# Altium schematic sheet Schematic_Hat_Secondary.SchDoc: WackyRacersHat Battery
size A3; DrawnBy: Group 26; Address1: ECE Department; Address2: University of Canterbury; Address3: Christchurch 8041; Address4: New Zealand; Revision: 1; SheetNumber: 2; SheetTotal: 2; ImagePath: \\maxwell\elecapp\AltiumDesigner\Templates\uc-logo.png
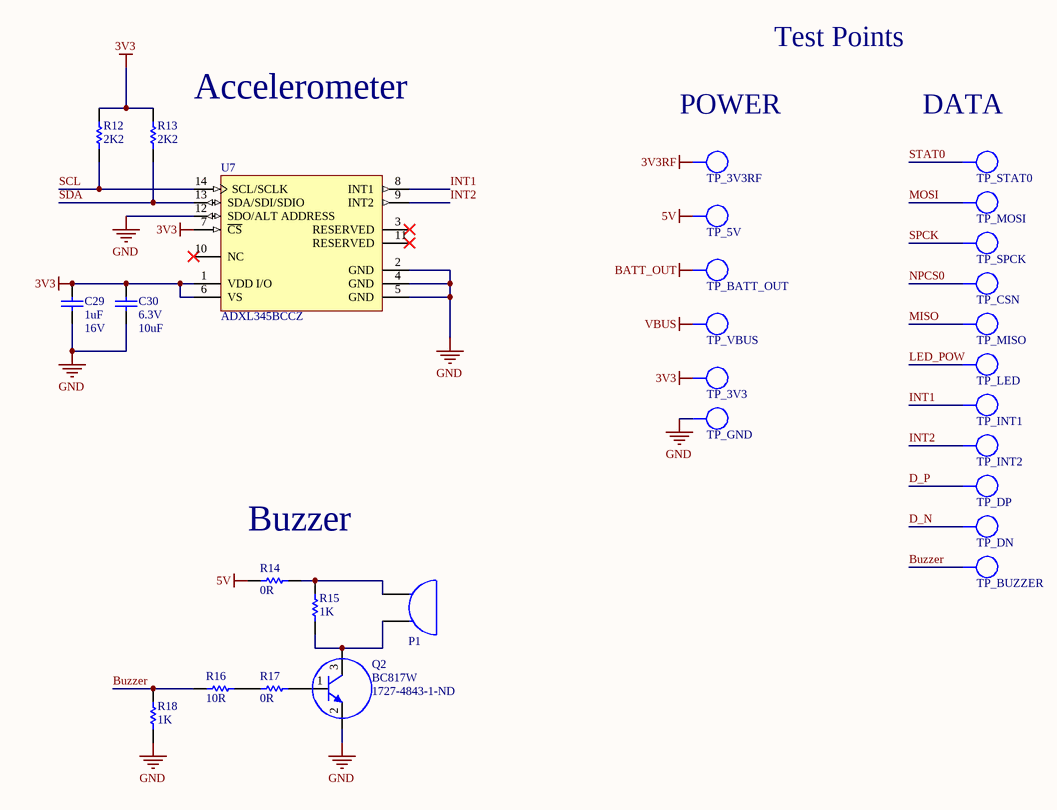
[diagram p0: Schematic_Hat_Secondary.SchDoc]

## Parts
C29  Max Voltage: 16V  [CAPC1608L]  (hidden comment: 1uF)
C30  Voltage - Rated: 6.3V  [CAPC1608L]  (hidden comment: 10uF)
P1  Piezo Buzzer  [BUZZER]  (value not drawn)
Q2  Supplier Part Number 2: 1727-4843-1-ND  [SOT323_M]  (hidden comment: BC817W)
R12  2K2  [RESC1608L]
R13  2K2  [RESC1608L]
R14  0R  [RESC1608L]
R15  1K  [RESC1608L]
R16  10R  [RESC1608L]
R17  0R  [RESC1608L]
R18  1K  [RESC1608L]
TP_3V3  3V3  [TP_1206]  (value not drawn)  (no BOM)
TP_3V3RF  3V3RF  [TP_1206]  (value not drawn)  (no BOM)
TP_5V  5V  [TP_1206]  (value not drawn)  (no BOM)
TP_BATT_OUT  BATT_OUT  [TP_1206]  (value not drawn)  (no BOM)
TP_BUZZER  BUZZER  [TP_1206]  (value not drawn)  (no BOM)
TP_CSN  CSN  [TP_1206]  (value not drawn)  (no BOM)
TP_DN  DN  [TP_1206]  (value not drawn)  (no BOM)
TP_DP  DP  [TP_1206]  (value not drawn)  (no BOM)
TP_GND  GND  [TP_1206]  (value not drawn)  (no BOM)
TP_INT1  INT1  [TP_1206]  (value not drawn)  (no BOM)
TP_INT2  INT2  [TP_1206]  (value not drawn)  (no BOM)
TP_LED  LED  [TP_1206]  (value not drawn)  (no BOM)
TP_MISO  MISO  [TP_1206]  (value not drawn)  (no BOM)
TP_MOSI  MOSI  [TP_1206]  (value not drawn)  (no BOM)
TP_SPCK  SPCK  [TP_1206]  (value not drawn)  (no BOM)
TP_STAT0  STAT0  [TP_1206]  (value not drawn)  (no BOM)
TP_VBUS  VBUS  [TP_1206]  (value not drawn)  (no BOM)
U7  ADXL345BCCZ  [ADI-CC-14-1_V]

## Nets
3V3: C29.2 C30.2 R12.2 R13.2 TP_3V3.1 U7.1(VDD_I/O) U7.6(VS) U7.7(~{CS})
3V3RF: TP_3V3RF.1
5V: R14.2 TP_5V.1
BATT_OUT: TP_BATT_OUT.1
GND: C29.1 C30.1 Q2.2 R18.1 TP_GND.1 U7.2(GND) U7.4(GND) U7.5(GND) U7.12(SDO/ALT_ADDRESS)
VBUS: TP_VBUS.1
Buzzer: R16.1 R18.2 TP_BUZZER.1
D_N: TP_DN.1
D_P: TP_DP.1
INT1: TP_INT1.1 U7.8(INT1)
INT2: TP_INT2.1 U7.9(INT2)
LED_POW: TP_LED.1
MISO: TP_MISO.1
MOSI: TP_MOSI.1
NPCS0: TP_CSN.1
SCL: R12.1 U7.14(SCL/SCLK)
SDA: R13.1 U7.13(SDA/SDI/SDIO)
SPCK: TP_SPCK.1
STAT0: TP_STAT0.1
NetP1_1: P1.1 R14.1 R15.2
NetP1_2: P1.2 Q2.3 R15.1
NetQ2_1: Q2.1 R17.1
NetR16_2: R16.2 R17.2

Not connected (* = marked no-connect by the designer): U7 3(RESERVED)* 10(NC)* 11(RESERVED)*

## Notes on the sheet
- Test Points
- (near R13) Accelerometer
- (near TP_3V3RF) POWER
- (near TP_STAT0) DATA
- Buzzer
- Title
- Drawn by:
- Date:
- Time:
- Revision:
- Sheet
- of
- File:

## Library data of the parts
C29 = CC_1uF_0603: CAP CER 1uF Y5V -20% +80% 16V 0603; PackageReference: 0603; Code_IPC: 1608 [0603]; Verify: *; Supplier: ECE Dept; Storage Location: PCB Assembly WS; Value: 1uF
C30 = CC_10uF_0603: CAP CER 10UF X5R +-20% 6V3 0603; Supplier: ECE Dept; Storage Location: PCB Assembly WS; Value: 10uF
P1 = Piezo Buzzer: TDK - PS1240P02BT - BUZZER, PIEZO, 70DB, 12.2MM; Number of Terminals/Pins: 2; Frequency: 4kHz; Operating Supply Voltage: 3V; Washable: No; Supplier 1: Digi-Key; Manufacturer 1: TDK; Manufacturer Part Number 1: PS1240P02BT; Stock 1: 24025; Pricing 1: 1=0.61000, 10=0.52500, 25=0.49120, 50=0.46580, 100=0.44110 (USD); RoHS: Yes; Mount: Through Hole; Number of Pins: 2; Min Operating Temperature: -10°C; Max Operating Temperature: 70°C; Package Quantity: 1; Packaging: Tape and Reel; Termination: PC Pins; Voltage Rating (DC): 3V; Series: PS; Diameter: 12.2mm; Height: 6.5mm; Lead Free: Lead Free; RoHS Compliant: Yes; ComponentLink1URL: https://datasheet.ciiva.com/0/ef532-ps-112.pdf?src-supplier=Digi-Key; ComponentLink1Description: https://datasheet.ciiva.com/0/ef532-ps-112.pdf?src-supplier=Digi-Key; ComponentLink2URL: https://datasheet.ciiva.com/0/ef532-ps-111.pdf?src-supplier=Digi-Key; ComponentLink2Description: https://datasheet.ciiva.com/0/ef532-ps-111.pdf?src-supplier=Digi-Key; ComponentLink3URL: https://datasheet.ciiva.com/3306/ef532-ps-3306958.pdf?src-supplier=Avnet; ComponentLink3Description: https://datasheet.ciiva.com/3306/ef532-ps-3306958.pdf?src-supplier=Avnet; ComponentLink4URL: https://datasheet.ciiva.com/16225/ef532-ps-16225062.pdf?src-supplier=Onlinecomponents.com; ComponentLink4Description: https://datasheet.ciiva.com/16225/ef532-ps-16225062.pdf?src-supplier=Onlinecomponents.com; Supplier Part Number 1: 445-2525-1-ND
Q2 = TB_BC817W: NPN GP Bipolar Transistor 45V 500mA SOT323; Manufacturer: NXP; Supplier 1: Farnell; Supplier Part Number 1: 2114873; Manufacturer PN: BC817W; Storage Location: PCB Assembly WS; Supplier: ECE Dept; Supplier 2: Digi-Key; Value: BC817W
R12 R13 = RS_2K2: RES 2.2K OHM 1/10W 5% 0603 SMD; Storage Location: PCB Assembly WS; Supplier: ECE Dept; Value: 2K2
R14 R17 = RS_0R0: RES 0.0 OHM 1/10W 5% 0603 SMD; Storage Location: PCB Assembly WS; Supplier: ECE Dept; Value: 0R
R15 R18 = RS_1K: RES 1.0K OHM 1/10W 5% 0603 SMD; Storage Location: PCB Assembly WS; Supplier: ECE Dept; Value: 1K
R16 = RS_10R: RES 10 OHM 1/10W 5% 0603 SMD; Storage Location: PCB Assembly WS; Supplier: ECE Dept; Value: 10R
TP_3V3 TP_3V3RF TP_5V TP_BATT_OUT TP_BUZZER TP_CSN TP_DN TP_DP TP_GND TP_INT1 TP_INT2 TP_LED TP_MISO TP_MOSI TP_SPCK TP_STAT0 TP_VBUS = TP_1206: Test-Point 3.3x1.6x2.1mm SMD; Manufacturer: Harwin Inc; Manufacturer Part Number: S1751-46R; Value: TP; Manufacturer PN: *; Storage Location: ProtoPlace; Mounting Type: Surface Mount; Type: PC Test Point; Supplier 1: Digi-Key; Supplier Part Number 1: 952-1478-2-ND; Supplier 2: Farnell; Supplier Part Number 2: 1826282; Supplier: ECE Dept
U7 = ADXL345BCCZ: Accelerometer 3-Axis, +/-2 g / +/-4 g / +/-8 g / +/-16 g with Digital Output, 1.6 KHz BW, Industrial, 14-pin LGA, Tray; Manufacturer: Analog Devices; Sensitivity: 256/128/64/32 LSB/g; Voltage Supply (V): 2.0 to 3.6; Supply Current: 140 uA; # of Axes: 3; -3dB Bandwidth: 1.6 KHz; PackageReference: CC-14-1; ComponentLink1Description: Manufacturer URL; Packing: Tray; ComponentLink4URL: http://www.analog.com/en/mems-sensors/mems-inertial-sensors/adxl345/products/product.html; ComponentLink2URL: http://www.analog.com/static/imported-files/data_sheets/ADXL345.pdf; Mounting Technology: Surface Mount; ComponentLink3URL: http://www.analog.com/static/imported-files/data_sheets/ADXL343.pdf; PartNumber: ADXL345BCCZ; ComponentLink4Description: Product URL; Output Type: Digital; ComponentLink3Description: Package Specification; DatasheetVersion: Rev. D; PackageVersion: 03-16-2010-A, 03/2010; ComponentLink1URL: http://www.analog.com/en/index.html; ComponentLink2Description: Datasheet; PackageDescription: 14-Pin Land Grid Array, 3 x 5 mm Body, 0.8 mm Pitch; Manufacturer 1: Analog Devices; Manufacturer Part Number 1: ADXL345BCCZ